# Altium schematic sheet Connector_Sheet.SchDoc
size A4; SheetNumber: 5; SheetTotal: 5
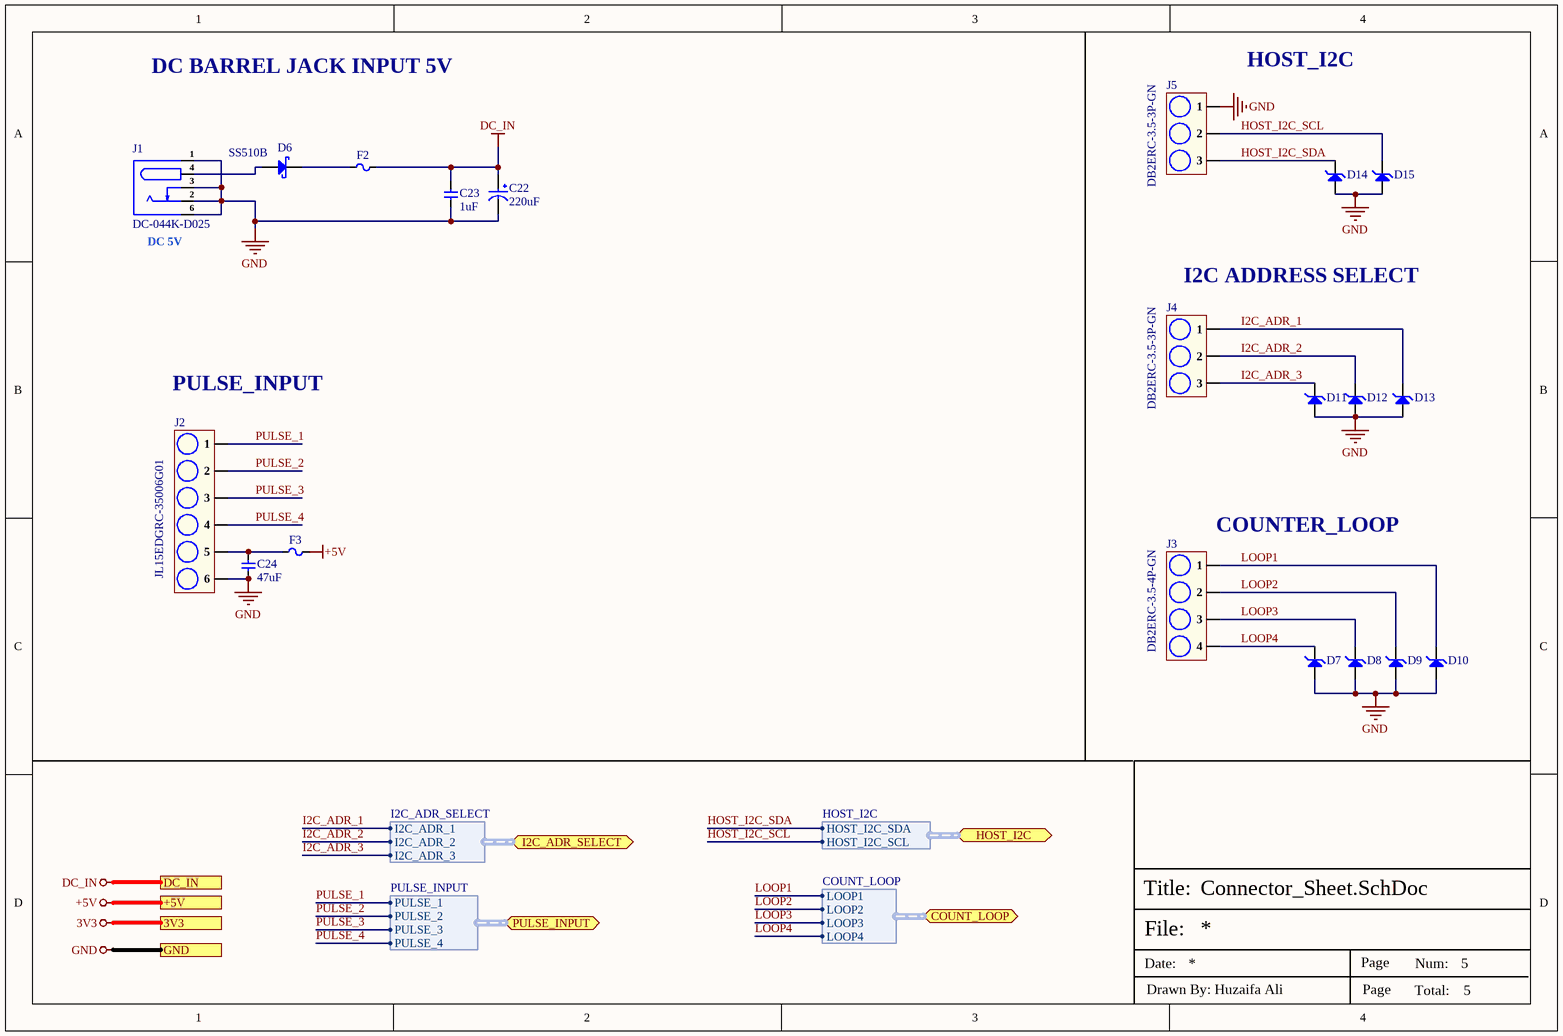
[diagram p0: Connector_Sheet.SchDoc]

## Parts
C22  220uF  [189RV0019]
C23  1uF  [Cap-0805]
C24  47uF  [Cap-1206]
D6  SS510B  [SMB_]
D7  PESDHC3D3V3U  [SOD-323]  (value not drawn)
D8  PESDHC3D3V3U  [SOD-323]  (value not drawn)
D9  PESDHC3D3V3U  [SOD-323]  (value not drawn)
D10  PESDHC3D3V3U  [SOD-323]  (value not drawn)
D11  PESDHC3D3V3U  [SOD-323]  (value not drawn)
D12  PESDHC3D3V3U  [SOD-323]  (value not drawn)
D13  PESDHC3D3V3U  [SOD-323]  (value not drawn)
D14  PESDHC3D3V3U  [SOD-323]  (value not drawn)
D15  PESDHC3D3V3U  [SOD-323]  (value not drawn)
F2  1210L075/24PR  [FUSE-1210]  (value not drawn)
F3  1210L075/24PR  [FUSE-1210]  (value not drawn)
J1  DC-044K-D025  [DC-044K-D025]
J2  JL15EDGRC-35006G01  [JL15EDGRC-35006G01]
J3  DB2ERC-3.5-4P-GN  [DB2ERC-3.5-4P-GN]
J4  DB2ERC-3.5-3P-GN  [DB2ERC-3.5-3P-GN]
J5  DB2ERC-3.5-3P-GN  [DB2ERC-3.5-3P-GN]

## Ports
3V3, +5V, COUNT_LOOP (bidir, harness COUNT_LOOP), DC_IN, GND, HOST_I2C (bidir, harness HOST_I2C), I2C_ADR_SELECT (bidir, harness I2C_ADR_SELECT), PULSE_INPUT (bidir, harness PULSE_INPUT)

## Harnesses
PULSE_INPUT: PULSE_1, PULSE_2, PULSE_3, PULSE_4
COUNT_LOOP: LOOP1, LOOP2, LOOP3, LOOP4
I2C_ADR_SELECT: I2C_ADR_1, I2C_ADR_2, I2C_ADR_3
HOST_I2C: HOST_I2C_SDA, HOST_I2C_SCL

## Nets
3V3: port 3V3
+5V: F3.2 ; port +5V
DC_IN: C22.1 C23.2 F2.2 ; port DC_IN
GND: C22.2 C23.1 C24.1 D7.2(A) D8.2(A) D9.2(A) D10.2(A) D11.2(A) D12.2(A) D13.2(A) D14.2(A) D15.2(A) J1.1 J1.2 J1.3 J1.6 J2.6 J5.1 ; port GND
HOST_I2C_SCL: D15.1(C) J5.2 ; port HOST_I2C.HOST_I2C_SCL
HOST_I2C_SDA: D14.1(C) J5.3 ; port HOST_I2C.HOST_I2C_SDA
I2C_ADR_1: D13.1(C) J4.1 ; port I2C_ADR_SELECT.I2C_ADR_1
I2C_ADR_2: D12.1(C) J4.2 ; port I2C_ADR_SELECT.I2C_ADR_2
I2C_ADR_3: D11.1(C) J4.3 ; port I2C_ADR_SELECT.I2C_ADR_3
LOOP1: D10.1(C) J3.1 ; port COUNT_LOOP.LOOP1
LOOP2: D9.1(C) J3.2 ; port COUNT_LOOP.LOOP2
LOOP3: D8.1(C) J3.3 ; port COUNT_LOOP.LOOP3
LOOP4: D7.1(C) J3.4 ; port COUNT_LOOP.LOOP4
PULSE_1: J2.1 ; port PULSE_INPUT.PULSE_1
PULSE_2: J2.2 ; port PULSE_INPUT.PULSE_2
PULSE_3: J2.3 ; port PULSE_INPUT.PULSE_3
PULSE_4: J2.4 ; port PULSE_INPUT.PULSE_4
NetC24_2: C24.2 F3.1 J2.5
NetD6_1: D6.1(A) J1.4
NetD6_2: D6.2(K) F2.1

## Notes on the sheet
- DC BARREL JACK INPUT 5V
- HOST_I2C
- (near J1) DC 5V
- (near J4) I2C ADDRESS SELECT
- (near J2) PULSE_INPUT
- (near J3) COUNTER_LOOP
- File:
- Title:
- Date:
- Page
- Num:
- Total:
- Drawn By: Huzaifa Ali

## Library data of the parts
C22 = 189RV0019: 220uF 35V 600mA@100KHz 160mΩ@100KHz ±20% SMD,D6.3xL7.7mm Aluminum Electrolytic Capacitors - SMD ROHS; Manufacturer: KNSCHA; Manufacturer Part Number: 189RV0019; Package: SMD,D6.3xL7.7mm; LCSC Part Number: C7471881; Item Type: Capacitors; ComponentLink1Description: LCSC; ComponentLink1URL: https://www.lcsc.com/product-detail/Aluminum-Electrolytic-Capacitors-SMD_KNSCHA-189RV0019_C7471881.html
C23 = GCM21BC72A105KE36L: CAP CER 1UF 100V X7S 0805; Manufacturer: Murata; Tolerance: 10%; Supplier 1: Digi-Key; Manufacturer Part Number: GCM21BC72A105KE36L; RoHS: Yes; Category: Ceramic Capacitors; Stock 1: 179138; Pricing 1: 1=0.48000, 10=0.34100, 50=0.25800, 100=0.22480, 500=0.16650, 1000=0.14152 (USD); Mount: Surface Mount; Case/Package: 0805; Case Code (Imperial): 0805; Case Code (Metric): 2012; Min Operating Temperature: -55°C; Max Operating Temperature: 125°C; Packaging: Cut Tape; Capacitance: 1uF; Voltage Rating: 100V; Ratings: AEC-Q200; RoHS Compliant: Yes; ComponentLink1URL: http://search.murata.co.jp/Ceramy/image/img/A01X/partnumbering_e_02.pdf?src-supplier=Digi-Key; ComponentLink1Description: http://search.murata.co.jp/Ceramy/image/img/A01X/partnumbering_e_02.pdf?src-supplier=Digi-Key; Supplier Part Number 1: 490-14436-1-ND; LCSC Part Number: C2842838
C24 = GRM31CR61E476ME44L: CAP CER 47UF 25V X5R 1206; Manufacturer: Murata; Tolerance: 20%; Item Type: Capacitor; Supplier 1: Digi-Key; Manufacturer Part Number: GRM31CR61E476ME44L; RoHS: Yes; Category: Ceramic Capacitors; Capacitance: 47uF; Voltage Rating (DC): 25V; Dielectric: X5R; Length: 3.2mm; Width: 1.6mm; Thickness: 1.6mm; ComponentLink1URL: https://search.murata.co.jp/Ceramy/image/img/A01X/partnumbering_e_01.pdf?src-supplier=Digi-Key; ComponentLink1Description: https://search.murata.co.jp/Ceramy/image/img/A01X/partnumbering_e_01.pdf?src-supplier=Digi-Key; Supplier Part Number 1: 490-16268-2-ND; LCSC Part Number: C403725
D6 = SS510B: SCHOTTKY DIODE SMB 100V 5A; Manufacturer: MDD; Manufacturer Part Number: SS510B; Package: SMB; ComponentLink1Description: LCSC; ComponentLink1URL: https://www.lcsc.com/product-detail/Schottky-Barrier-Diodes-SBD_JUXING-SS510B_C3011128.html; LCSC Part Number: C3011128; Item Type: Diode
D7-D15 = PESDHC3D3V3U: 15A@8/20us 9V 5V 3.3V Unidirectional SOD-323 TVS ROHS; Manufacturer: Shanghai Prisemi Elec; Item Type: Diode; Manufacturer Part Number: PESDHC3D3V3U; Package: SOD-323; LCSC Part Number: C496538; ComponentLink1Description: LCSC; ComponentLink1URL: https://www.lcsc.com/product-detail/TVS_Shanghai-Prisemi-Elec-PESDHC3D3V3U_C496538.html
F2 F3 = 1210L075/24PR: 24V 750mA 100A 1.5A 1210 Resettable Fuses ROHS; Manufacturer: Littlefuse; Item Type: Fuse; Manufacturer Part Number: 1210L075/24PR; Supplier: Digikey; Supplier Part Number: F4146CT-ND; RoHS: Yes; Category: PTC Resettable Fuses; Stock: 2300; Pricing: 1=0.98, 5=0.81, 10=0.747, 50=0.6196, 100=0.5716, 250=0.51376, 500=0.47378, 1000=0.43676 (USD); Current Rating: 100A; Voltage Rating: 24V; Height: 1.8mm; Lead Free: 5697LeadFree; ComponentLink1URL: https://datasheet.ciiva.com/8005/littelfuse-ptc-1210l-8005372.pdf?src-supplier=Element14; ComponentLink1Description: https://datasheet.ciiva.com/8005/littelfuse-ptc-1210l-8005372.pdf?src-supplier=Element14; ComponentLink2URL: https://datasheet.ciiva.com/326/littelfuse-ptc-1210l-326060.pdf?src-supplier=Digikey; ComponentLink2Description: https://datasheet.ciiva.com/326/littelfuse-ptc-1210l-326060.pdf?src-supplier=Digikey; ComponentLink3URL: https://datasheet.ciiva.com/326/littelfuse-ptc-1210l-326061.pdf?src-supplier=Digikey; ComponentLink3Description: https://datasheet.ciiva.com/326/littelfuse-ptc-1210l-326061.pdf?src-supplier=Digikey; ComponentLink4URL: https://datasheet.ciiva.com/326/littelfuse-ptc-1210l-326062.pdf?src-supplier=Digikey; ComponentLink4Description: https://datasheet.ciiva.com/326/littelfuse-ptc-1210l-326062.pdf?src-supplier=Digikey; LCSC Part Number: C207045
J1 = DC-044K-D025: Bend insert DC Power Receptacle -30℃~+85℃ 2.5mm 6mm 7A 24V Plugin DC Power Connectors ROHS; Manufacturer: G-Switch; Manufacturer Part Number: DC-044K-D025; Package: Plugin; LCSC Part Number: C963204; Item Type: DC Power Connectors; ComponentLink1Description: LCSC; ComponentLink1URL: https://www.lcsc.com/product-detail/DC-Power-Connectors_G-Switch-DC-044K-D025_C963204.html
J2 = JL15EDGRC-35006G01: 300V 8A 6 Bend -40℃~+105℃ 1 3.5mm 1x6P Green Receptacle-Close Push-Pull,P=3.5mm Pluggable System Terminal Block ROHS; Manufacturer: JILN; Manufacturer Part Number: JL15EDGRC-35006G01; Package: Push-Pull,P=3.5mm; LCSC Part Number: C409119; Item Type: Terminal Block; ComponentLink1Description: LCSC; ComponentLink1URL: https://www.lcsc.com/product-detail/Pluggable-System-Terminal-Block_JILN-JL15EDGRC-35006G01_C409119.html
J3 = DB2ERC-3.5-4P-GN: 250V 10A 4 Bend -40℃~+105℃ 1 3.5mm 1x4P Green Receptacle-Close Push-Pull,P=3.5mm Pluggable System Terminal Block ROHS; Manufacturer: DORABO; Manufacturer Part Number: DB2ERC-3.5-4P-GN; Package: Push-Pull,P=3.5mm; LCSC Part Number: C395831; Item Type: Terminal Block; ComponentLink1Description: LCSC; ComponentLink1URL: https://www.lcsc.com/product-detail/Pluggable-System-Terminal-Block_DORABO-DB2ERC-3-5-4P-GN_C395831.html?s_z=n_DB2ERC-3.5-4P
J4 J5 = DB2ERC-3.5-3P-GN: 250V 10A 3 Bend -40℃~+105℃ 1 3.5mm 1x3P Green Board Edge/Receptacle-Close Push-Pull,P=3.5mm Pluggable System Terminal Block ROHS; Manufacturer: DORABO; Manufacturer Part Number: DB2ERC-3.5-3P-GN; Package: Push-Pull,P=5.08mm; LCSC Part Number: C430551; Item Type: Terminal Block; ComponentLink1Description: LCSC; ComponentLink1URL: https://www.lcsc.com/product-detail/Pluggable-System-span-style-background-color-ff0-Terminal-span-span-style-background-color-ff0-Block-span_DORABO-DB2ERC-3-5-3P-GN_C430551.html